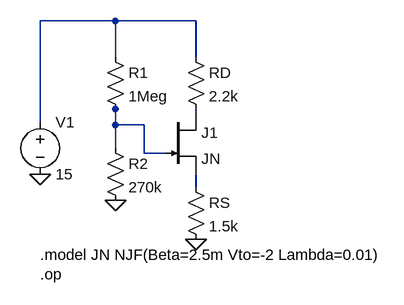
[diagram p0: schematic Ex05.asc]
Ex05.asc, the LTspice schematic file:
Version 4
SHEET 1 880 680
WIRE 100 216 100 60
WIRE 100 60 216 60
WIRE 216 60 216 116
WIRE 216 60 340 60
WIRE 340 60 340 116
WIRE 216 196 216 256
WIRE 216 196 216 220
WIRE 216 220 260 220
WIRE 260 220 260 264
WIRE 260 264 292 264
WIRE 340 196 340 200
WIRE 340 296 340 316
FLAG 100 296 0
FLAG 216 336 0
FLAG 340 396 0
SYMBOL voltage 100 200 R0
SYMATTR InstName V1
SYMATTR Value 15
SYMBOL res 200 100 R0
SYMATTR InstName R1
SYMATTR Value 1Meg
SYMBOL res 200 240 R0
SYMATTR InstName R2
SYMATTR Value 270k
SYMBOL res 324 100 R0
SYMATTR InstName RD
SYMATTR Value 2.2k
SYMBOL njf 292 200 R0
SYMATTR InstName J1
SYMATTR Value JN
SYMBOL res 324 300 R0
SYMATTR InstName RS
SYMATTR Value 1.5k
TEXT 100 420 Left 2 !.model JN NJF(Beta=2.5m Vto=-2 Lambda=0.01)
TEXT 100 450 Left 2 !.op

The netlist it stands for:
* Ex05.asc
V1 N001 0 15
R1 N001 N002 1Meg
R2 N002 0 270k
RD N001 N003 2.2k
J1 N003 N002 N004 JN
RS N004 0 1.5k
.model NJF NJF
.model PJF PJF
.lib standard.jft
.model JN NJF(Beta=2.5m Vto=-2 Lambda=0.01)
.op
.backanno
.end